# Altium schematic sheet Power_Section.SchDoc
size A4; DocumentNumber: 2; SheetNumber: 2; SheetTotal: 28
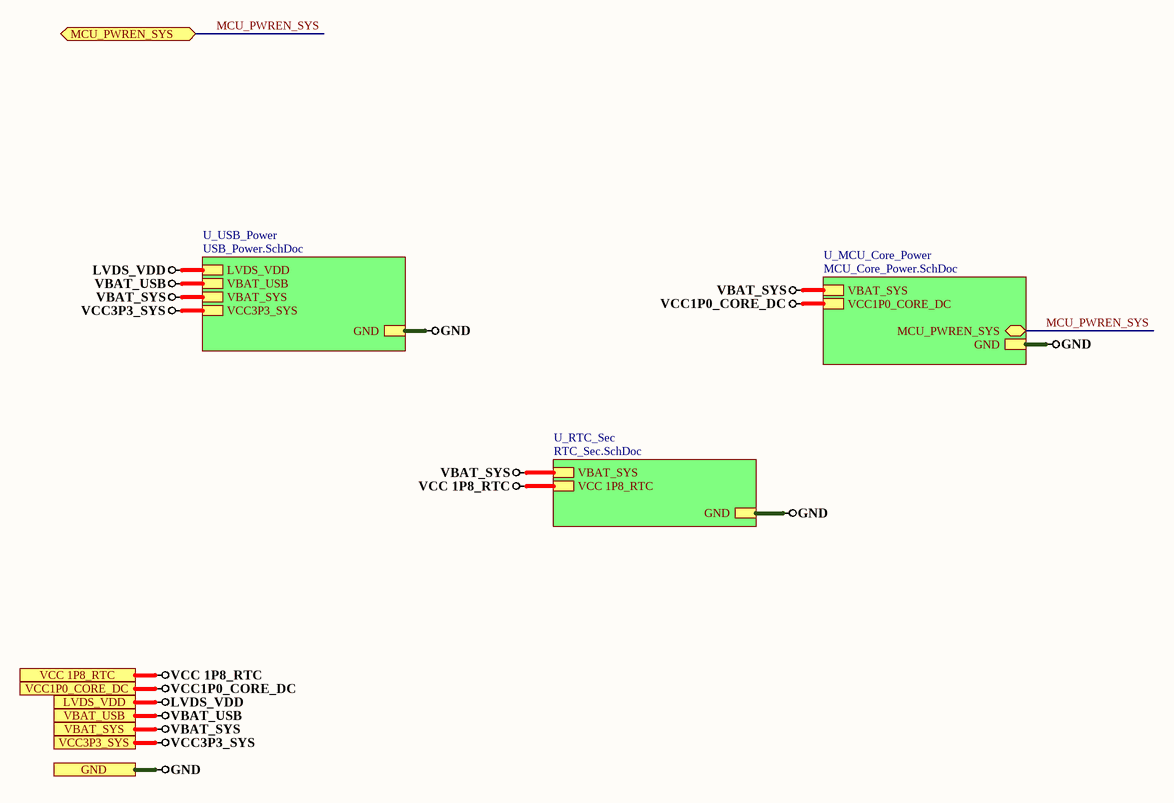
[diagram p0: Power_Section.SchDoc]

## Sub-sheets
U_MCU_Core_Power = MCU_Core_Power.SchDoc: GND, VCC1P0_CORE_DC, VBAT_SYS, MCU_PWREN_SYS (bidir)
U_RTC_Sec = RTC_Sec.SchDoc: GND, VBAT_SYS, VCC 1P8_RTC
U_USB_Power = USB_Power.SchDoc: GND, LVDS_VDD, VBAT_USB, VBAT_SYS, VCC3P3_SYS

## Ports
GND, LVDS_VDD, MCU_PWREN_SYS (bidir), VBAT_SYS, VBAT_USB, VCC1P0_CORE_DC, VCC3P3_SYS, VCC 1P8_RTC

## Nets
GND: port GND, sheet U_USB_Power/GND, sheet U_MCU_Core_Power/GND, sheet U_RTC_Sec/GND
LVDS_VDD: port LVDS_VDD, sheet U_USB_Power/LVDS_VDD
VBAT_SYS: port VBAT_SYS, sheet U_USB_Power/VBAT_SYS, sheet U_MCU_Core_Power/VBAT_SYS, sheet U_RTC_Sec/VBAT_SYS
VBAT_USB: port VBAT_USB, sheet U_USB_Power/VBAT_USB
VCC1P0_CORE_DC: port VCC1P0_CORE_DC, sheet U_MCU_Core_Power/VCC1P0_CORE_DC
VCC3P3_SYS: port VCC3P3_SYS, sheet U_USB_Power/VCC3P3_SYS
VCC 1P8_RTC: port VCC 1P8_RTC, sheet U_RTC_Sec/VCC 1P8_RTC
MCU_PWREN_SYS: port MCU_PWREN_SYS, sheet U_MCU_Core_Power/MCU_PWREN_SYS